# Altium schematic sheet Sheet1.SchDoc
size A4
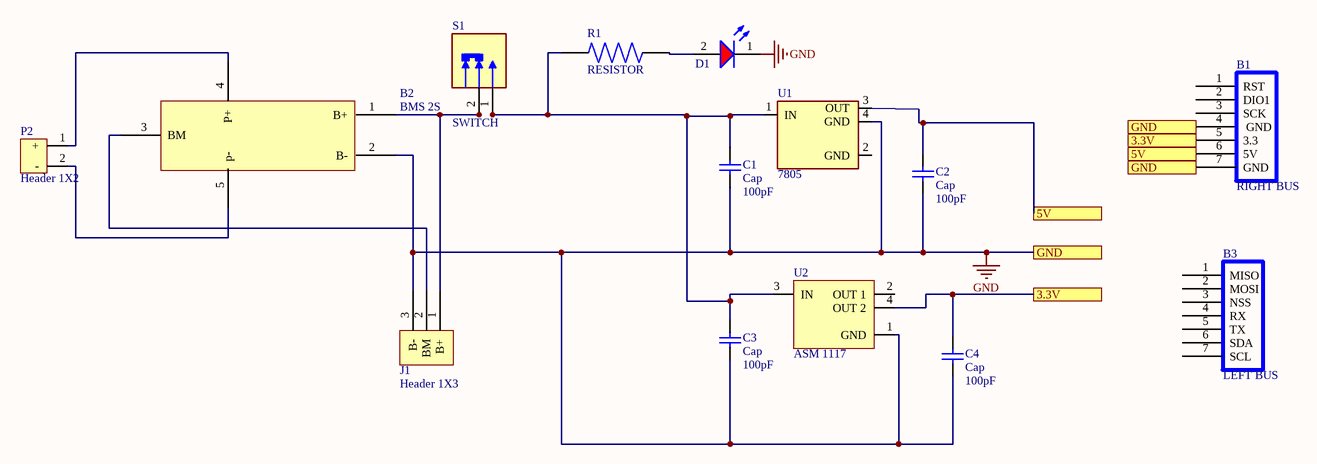
[diagram p0: Sheet1.SchDoc]

## Parts
B1  RIGHT BUS  [bus left]
B2  BMS 2S  [BMS 2S]
B3  LEFT BUS  [bus right]
C1  Cap  value 100pF  [capacitor]
C2  Cap  value 100pF  [capacitor]
C3  Cap  value 100pF  [capacitor]
C4  Cap  value 100pF  [capacitor]
D1  Super Red, 2V, 140°  [LED red]  (value not drawn)
J1  Header 1X3  [Header 1X3]
P2  Header 1X2  [Header 2 pin]
R1  RESISTOR  [RESISTOR]
S1  SWITCH  [SWITCH]
U1  7805  [7805]
U2  ASM 1117  [7805]

## Ports
3.3V, 5V, GND

## Nets
GND: B1.4(GND) B1.7(GND) B2.2(B-) C1.1 C2.1 C3.1 C4.1 D1.1(K) J1.3(B-) U1.4(GND) U2.1(GND) ; port GND
3.3V: B1.5(3.3) C4.2 U2.4(OUT_2) ; port 3.3V
5V: B1.6(5V) C2.2 U1.3(OUT) ; port 5V
NetB2_1: B2.1(B+) J1.1(B+) S1.2
NetB2_3: B2.3(BM) J1.2(BM)
NetB2_4: B2.4(P+) P2.1(+)
NetB2_5: B2.5(p-) P2.2(-)
NetC1_2: C1.2 C3.2 R1.1 S1.1 U1.1(IN) U2.3(IN)
NetD1_2: D1.2(A) R1.2

Not connected (* = marked no-connect by the designer): B1 1(RST) 2(DIO1) 3(SCK); B3 1(MISO) 2(MOSI) 3(NSS) 4(RX) 5(TX) 6(SDA) 7(SCL); U1 2(GND); U2 2(_OUT_1)

## Library data of the parts
B1 = BUS right
B3 = BUS left
C1-C4 = Cap: Capacitor; Published: 8-Jun-2000; LatestRevisionDate: 17-Jul-2002; LatestRevisionNote: Re-released for DXP Platform.; PackageReference: RAD-0.3; Publisher: Altium Limited; PackageDescription: Radial Cap, Thru-Hole; 2 Leads; 0.3 in Pin Spacing
D1 = LED red: WL-SMCD Mono-color Chip LED Diffused, SMT, size 0603, Super Red, 2V, 140°; Manufacturer Part Number: 150060SS55040; Manufacturer: Wurth Elektronik; Case/Size Code: 0603; Chip Technology: AlInGaP; Dominant Wavelength: 630nm; Luminous Intensity: 70mcd; Peak Wavelength: 645nm; Category: Signal LEDs; Match Code: WL-SMCD; ComponentLink1Description: Website Link; ComponentLink1URL: https://www.we-online.com/redexpert/article/150060SS55040?ad; ComponentLink2Description: Datasheet Link; ComponentLink2URL: https://www.we-online.com/redexpert/spec/150060SS55040?ad; Mount: Surface Mount; Operating Temperature Max: 85°C; Operating Temperature Min: -40°C; Packaging: Tape and Reel; Length: 1.6mm; Width: 0.8mm; Height: 0.4mm; Emitting Color: Super Red; Forward Voltage: 2V; Viewing Angle: 140°
R1 = RESISTOR: RES SMD 270 OHM 5% 0.4W 0805; MP: ESR10EZPJ271; Package: None; Price: None; Value: *; Availability: Unavailable
S1 = SWITCH: Slide Switch SPST Through Hole; MF: C&K; MP: S101031MS02Q; SnapEDA_Link: https://www.snapeda.com/parts/S101031MS02Q/C%2526K/view-part/?ref=snap; Purchase-URL: https://pricing.snapeda.com/search/part/S101031MS02Q/?ref=eda; Package: None; Price: None; Availability: In Stock; Value: *; Check_prices: https://www.snapeda.com/parts/S101031MS02Q/C%2526K/view-part/?ref=eda
U1 = 7805: Linear Voltage Regulator IC 1 Output 1A SOT-223; MP: AZ1117EH-5.0TRG1; MF: Diodes Inc.; Package: SOT-223 Diodes Inc.; Digi-Key_Part_Number: AZ1117EH-5.0TRG1DICT-ND; SnapEDA_Link: https://www.snapeda.com/parts/AZ1117EH-5.0TRG1/Diodes%20Inc./view-part/795858/?ref=snap; Purchase-URL: https://pricing.snapeda.com/search/part/AZ1117EH-5.0TRG1/?ref=eda; Check_prices: https://www.snapeda.com/parts/AZ1117EH-5.0TRG1/Diodes%20Inc./view-part/795858/?ref=eda; Value: *